# Altium project ICM-42688-P.PrjPcb
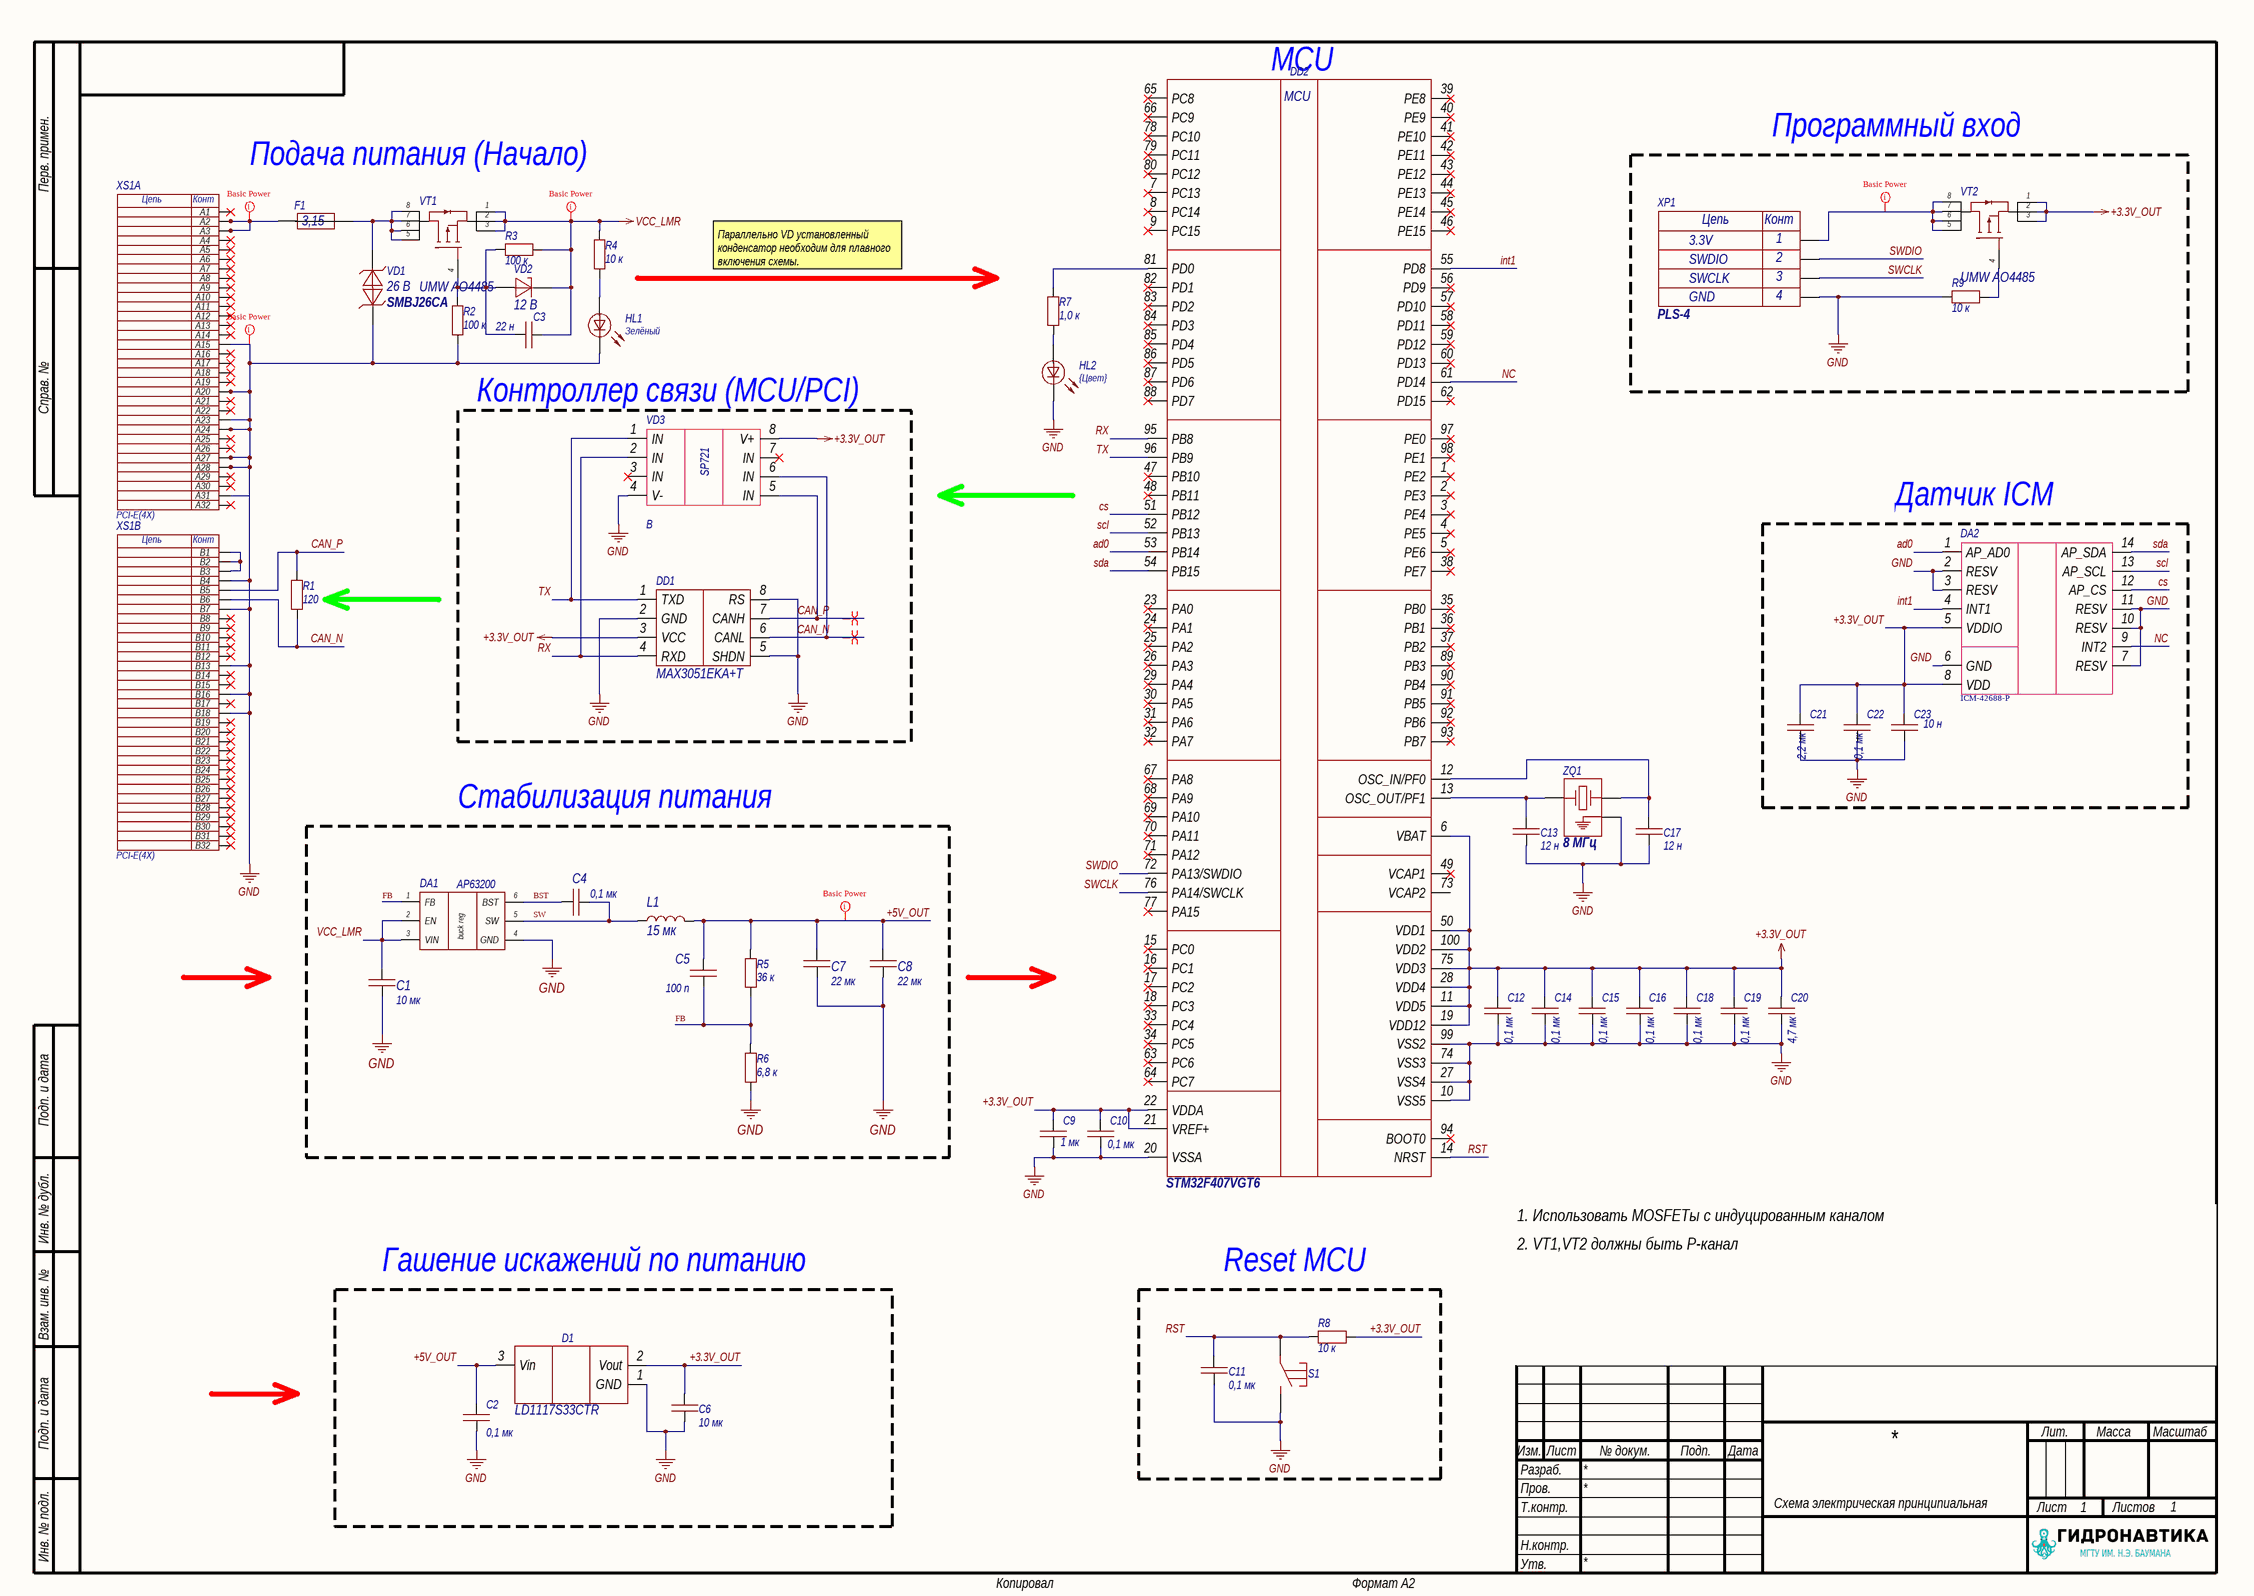
[diagram p0: Sheet1.SchDoc]
1 sheet, 50 parts. Net scope: global (net labels, ports and power ports of the same name join across sheets).
Board file: pci-e.PcbDoc

## Sheet Sheet1.SchDoc
size 594 x 420 mm; SheetNumber: 1; SheetTotal: 1

### Parts
C1  value 10 мк  [1210C]  (hidden comment: Capacitor)
C2  value 0,1 мк  [0603C]  (hidden comment: Capacitor)
C3  value 22 н  [0603C]  (hidden comment: Capacitor)
C4  value 0,1 мк  [0603C]  (hidden comment: Capacitor)
C5  value 100 п  [0603C]  (hidden comment: Capacitor)
C6  value 10 мк  [1210C]  (hidden comment: Capacitor)
C7  value 22 мк  [1210C]  (hidden comment: Capacitor)
C8  value 22 мк  [1210C]  (hidden comment: Capacitor)
C9  value 1 мк  [0603C]  (hidden comment: Capacitor)
C10  value 0,1 мк  [0603C]  (hidden comment: Capacitor)
C11  value 0,1 мк  [0402C]  (hidden comment: Capacitor)
C12  value 0,1 мк  [0603C]  (hidden comment: Capacitor)
C13  value 12 н  [0603C]  (hidden comment: Capacitor)
C14  value 0,1 мк  [0603C]  (hidden comment: Capacitor)
C15  value 0,1 мк  [0603C]  (hidden comment: Capacitor)
C16  value 0,1 мк  [0603C]  (hidden comment: Capacitor)
C17  value 12 н  [0603C]  (hidden comment: Capacitor)
C18  value 0,1 мк  [0603C]  (hidden comment: Capacitor)
C19  value 0,1 мк  [0603C]  (hidden comment: Capacitor)
C20  value 4,7 мк  [1206C]  (hidden comment: Capacitor)
C21  value 2,2 мк  [1206C]  (hidden comment: Capacitor)
C22  value 0,1 мк  [0603C]  (hidden comment: Capacitor)
C23  value 10 н  [0603C]  (hidden comment: Capacitor)
D1  LD1117S33CTR  [SOT223]
DA1  AP63200  [TSOT26]
DA2  ICM-42688-P  [ICM-42688-P]
DD1  MAX3051EKA+T  [SOT23-8]
DD2  STM32F407VGT6  [LQFP100]
F1  value 3,15  [01543.15DR]  (hidden comment: 01543.15DR)
HL1  value Зелёный  [0603D_green]  (hidden comment: LED 0603 GREEN)
HL2  value {Цвет}  [0603D_yellow]  (hidden comment: LED 0603 YELLOW)
L1  value 15 мк  [SP43]  (hidden comment: SP43-150K)
R1  value 120  [0603R]  (hidden comment: Resistor)
R2  value 100 к  [0603R]  (hidden comment: Resistor)
R3  value 100 к  [0603R]  (hidden comment: Resistor)
R4  value 10 к  [0603R]  (hidden comment: Resistor)
R5  value 36 к  [0603R]  (hidden comment: Resistor)
R6  value 6,8 к  [0603R]  (hidden comment: Resistor)
R7  value 1,0 к  [0603R]  (hidden comment: Resistor)
R8  value 10 к  [0603R]  (hidden comment: Resistor)
R9  value 10 к  [0603R]  (hidden comment: Resistor)
S1  TSS-TD-19XA-XTR  [TSS-TD-19XA-XTR]  (value not drawn)
VD1  SMBJ26CA  value 26 В  [SMB]
VD2  value 12 В  [SOD-323]  (hidden comment: BZX384-C12)
VD3  SP721  value В  [SP721]
VT1  UMW AO4485  [SOP8]
VT2  UMW AO4485  [SOP8]
XP1  PLS-4  Value3: SWCLK  Value2: SWDIO  Value4: GND  Value1: 3.3V  [PLS4-90]
XS1  PCI-E(4X)  [PCIexpress_x4_full]  (parts A,B of 2)
ZQ1  value 8 МГц  [QSMD3.2x2.5]  (hidden comment: XTAL_GND)

### Blocks framed on the sheet
Программный вход: R9 VT2 XP1
Контроллер связи (MCU/PCI): DD1 VD3
Датчик ICM: C21-C23 DA2
Стабилизация питания: C1 C4 C5 C7 C8 DA1 L1 R5 R6
Гашение искажений по питанию: C2 C6 D1
Reset MCU: C11 R8 S1

### Nets
+3.3V_OUT: C6.2 C9.2 C10.2 C12.2 C14.2 C15.2 C16.2 C18.2 C19.2 C20.2 C21.2 C22.2 C23.2 D1.2(Vout) DA2.5(VDDIO) DA2.8(VDD) DD1.3(VCC) DD2.6(VBAT) DD2.11(VDD5) DD2.19(VDD12) DD2.21(VREF+) DD2.22(VDDA) DD2.28(VDD4) DD2.50(VDD1) DD2.75(VDD3) DD2.100(VDD2) R8.1 VD3.8(V+) VT2.1 VT2.2 VT2.3
GND: C1.1 C2.1 C6.1 C7.1 C8.1 C9.1 C10.1 C11.1 C12.1 C13.1 C14.1 C15.1 C16.1 C17.1 C18.1 C19.1 C20.1 C21.1 C22.1 C23.1 D1.1(GND) DA1.4(GND) DA2.2(RESV) DA2.3(RESV) DA2.6(GND) DA2.7(RESV) DA2.10(RESV) DA2.11(RESV) DD1.2(GND) DD1.5(SHDN) DD1.8(RS) DD2.10(VSS5) DD2.20(VSSA) DD2.27(VSS4) DD2.74(VSS3) DD2.99(VSS2) HL1.2 HL2.2 R2.1 R6.1 R9.2 S1.2 VD1.1 VD3.4(V-) XP1.4 XS1.A15 XS1.A20 XS1.A23 XS1.A24 XS1.A27 XS1.A28 XS1.A31 XS1.B4 XS1.B7 XS1.B13 XS1.B16 XS1.B18 ZQ1.3
VCC_LMR: C1.2 C3.2 DA1.2(EN) DA1.3(VIN) R3.1 R4.2 VD2.2 VT1.1 VT1.2 VT1.3
+5V_OUT: C2.2 C5.2 C7.2 C8.2 D1.3(Vin) L1.2 R5.2
ad0: DA2.1(AP_AD0) DD2.53(PB14)
BST: C4.1 DA1.6(BST)
CAN_N: DD1.6(CANL) R1.1 VD3.6(IN) XS1.B6
CAN_P: DD1.7(CANH) R1.2 VD3.5(IN) XS1.B5
cs: DA2.12(AP_CS) DD2.51(PB12)
FB: C5.1 DA1.1(FB) R5.1 R6.2
int1: DA2.4(INT1) DD2.55(PD8)
NC: DA2.9(INT2) DD2.61(PD14)
RST: C11.2 DD2.14(NRST) R8.2 S1.1
RX: DD1.4(RXD) DD2.95(PB8) VD3.2(IN)
scl: DA2.13(AP_SCL) DD2.52(PB13)
sda: DA2.14(AP_SDA) DD2.54(PB15)
SW: C4.2 DA1.5(SW) L1.1
SWCLK: DD2.76(PA14/SWCLK) XP1.3
SWDIO: DD2.72(PA13/SWDIO) XP1.2
TX: DD1.1(TXD) DD2.96(PB9) VD3.1(IN)
NetC3_1: C3.1 R2.2 R3.2 VD2.1 VT1.4
NetC13_2: C13.2 DD2.13(OSC_OUT/PF1) ZQ1.1
NetC17_2: C17.2 DD2.12(OSC_IN/PF0) ZQ1.2
NetDD2_81: DD2.81(PD0) R7.2
NetF1_1: F1.1 XS1.A2 XS1.A3
NetF1_2: F1.2 VD1.2 VT1.5 VT1.6 VT1.7 VT1.8
NetHL1_1: HL1.1 R4.1
NetHL2_1: HL2.1 R7.1
NetR9_1: R9.1 VT2.4
NetVT2_5: VT2.5 VT2.6 VT2.7 VT2.8 XP1.1
NetXS1_B1: XS1.B1 XS1.B2 XS1.B3

Not connected (* = marked no-connect by the designer): DD2 1(PE2)* 2(PE3)* 3(PE4)* 4(PE5)* 5(PE6)* 7(PC13)* 8(PC14)* 9(PC15)* 15(PC0)* 16(PC1)* 17(PC2)* 18(PC3)* 23(PA0)* 24(PA1)* 25(PA2)* 26(PA3)* 29(PA4)* 30(PA5)* 31(PA6)* 32(PA7)* 33(PC4)* 34(PC5)* 35(PB0)* 36(PB1)* 37(PB2)* 38(PE7)* 39(PE8)* 40(PE9)* 41(PE10)* 42(PE11)* 43(PE12)* 44(PE13)* 45(PE14)* 46(PE15)* 47(PB10)* 48(PB11)* 49(VCAP1)* 56(PD9)* 57(PD10)* 58(PD11)* 59(PD12)* 60(PD13)* 62(PD15)* 63(PC6)* 64(PC7)* 65(PC8)* 66(PC9)* 67(PA8)* 68(PA9)* 69(PA10)* 70(PA11)* 71(PA12)* 73(VCAP2) 77(PA15)* 78(PC10)* 79(PC11)* 80(PC12)* 82(PD1)* 83(PD2)* 84(PD3)* 85(PD4)* 86(PD5)* 87(PD6)* 88(PD7)* 89(PB3)* 90(PB4)* 91(PB5)* 92(PB6)* 93(PB7)* 94(BOOT0)* 97(PE0)* 98(PE1)*; VD3 3(IN)* 7(IN)*; XS1 A1* A4* A5* A6* A7* A8* A9* A10* A11* A12* A13* A14* A16* A17* A18* A19* A21* A22* A25* A26* A29* A30* A32* B8* B9* B10* B11* B12* B14* B15* B17* B19* B20* B21* B22* B23* B24* B25* B26* B27* B28* B29* B30* B31* B32*

### Layout directives
differential pair: CAN_N, CAN_P
net class Power: +5V_OUT, GND, NetF1_1, NetVT2_5, VCC_LMR

### Notes on the sheet
- (near DD2) MCU
- Подача питания (Начало)
- Параллельно VD установленный конденсатор необходим для плавного включения схемы.
- 1. Использовать MOSFETы с индуцированным каналом
- 2. VT1,VT2 должны быть P-канал
- Перв. примен.
- Справ. №
- Подп. и дата
- Инв. № дубл.
- Взам. инв. №
- Разраб.
- Изм.
- Лист
- № докум.
- Подп.
- Дата
- Лит.
- Масса
- Масштаб
- Пров.
- Т.контр.
- Схема электрическая принципиальная
- Листов
- Инв. № подл.
- Утв.
- Н.контр.
- Копировал
- Формат А2
- (in symbol AP63200) buck reg
- (in symbol PCI-E(4X), part A) Цепь; Конт
- (in symbol PCI-E(4X), part B) Цепь; Конт
- (in symbol PLS4-90) Цепь; Конт
- (in symbol STM32F407VGT6) MCU

### Library data of the parts
C1 = Capacitor_10u_10_35V_X7R_1210C: Конденсатор 1210C ёмкостью 10 мк 10%, 35 В, X7R; Library Path2: Schematic\Capacitor.SchLib; Voltage (V): 35; Capacity (nF): 10000; Part Number: Capacitor_10u_10_35V_X7R_1210C; Tolerance: 10%; Dielectric: X7R
C2 C10 C12 C14-C16 C18 C19 C22 = Capacitor_0,1u_10_50V_X7R_0603C: Конденсатор 0603C ёмкостью 0,1 мк 10%, 50 В, X7R; Voltage (V): 50; Capacity (nF): 100; Part Number: Capacitor_0,1u_10_50V_X7R_0603C; Tolerance: 10%; Dielectric: X7R
C3 = Capacitor_22n_10_50V_X7R_0603C: Конденсатор 0603C ёмкостью 22 н 10%, 50 В, X7R; Voltage (V): 50; Capacity (nF): 22; Part Number: Capacitor_22n_10_50V_X7R_0603C; Tolerance: 10%; Dielectric: X7R
C4 = Capacitor_0,1u_10_50V_X7R_0603C: Конденсатор 0603C ёмкостью 0,1 мк 10%, 50 В, X7R; Library Path2: Schematic\Capacitor.SchLib; Voltage (V): 50; Capacity (nF): 100; Part Number: Capacitor_0,1u_10_50V_X7R_0603C; Tolerance: 10%; Dielectric: X7R
C5 = Capacitor_100p_10_50V_X7R_0603C: Конденсатор 0603C ёмкостью 100 п 10%, 50 В, X7R; Library Path2: Schematic\Capacitor.SchLib; Voltage (V): 50; Capacity (nF): 0,1; Part Number: Capacitor_100p_10_50V_X7R_0603C; Tolerance: 10%; Dielectric: X7R
C6 = Capacitor_10u_10_35V_X7R_1210C: Конденсатор 1210C ёмкостью 10 мк 10%, 35 В, X7R; Voltage (V): 35; Capacity (nF): 10000; Part Number: Capacitor_10u_10_35V_X7R_1210C; Tolerance: 10%; Dielectric: X7R
C7 C8 = Capacitor_22u_10_25V_X7R_1210C: Конденсатор 1210C ёмкостью 22 мк 10%, 25 В, X7R; Library Path2: Schematic\Capacitor.SchLib; Voltage (V): 25; Capacity (nF): 22000; Part Number: Capacitor_22u_10_25V_X7R_1210C; Tolerance: 10%; Dielectric: X7R
C9 = Capacitor_1u_10_25V_X7R_0603C: Конденсатор 0603C ёмкостью 1 мк 10%, 25 В, X7R; Voltage (V): 25; Capacity (nF): 1000; Part Number: Capacitor_1u_10_25V_X7R_0603C; Tolerance: 10%; Dielectric: X7R
C11 = Capacitor_0,1u_10_16V_X7R_0603C: Конденсатор 0402C ёмкостью 0,1 мк 10%, 16 В, X7R; Voltage (V): 16; Capacity (nF): 100; Автор: rreali; Part Number: Capacitor_0,1u_10_16V_X7R_0603C; Tolerance: 10%; Dielectric: X7R
C13 C17 = Capacitor_12n_10_50V_X7R_0603C: Конденсатор 0603C ёмкостью 12 н 10%, 50 В, X7R; Voltage (V): 50; Capacity (nF): 12; Part Number: Capacitor_12n_10_50V_X7R_0603C; Tolerance: 10%; Dielectric: X7R
C20 = Capacitor_4,7u_10_50V_X7R_1206C: Конденсатор 1206C ёмкостью 4,7 мк 10%, 50 В, X7R; Voltage (V): 50; Capacity (nF): 4700; Part Number: Capacitor_4,7u_10_50V_X7R_1206C; Tolerance: 10%; Dielectric: X7R
C21 = Capacitor_2,2u_10_50V_X7R_1206C: Конденсатор 1206C ёмкостью 2,2 мк 10%, 50 В, X7R; Voltage (V): 50; Capacity (nF): 2200; Part Number: Capacitor_2,2u_10_50V_X7R_1206C; Tolerance: 10%; Dielectric: X7R
C23 = Capacitor_10n_10_50V_X7R_0603C: Конденсатор 0603C ёмкостью 10 н 10%, 50 В, X7R; Voltage (V): 50; Capacity (nF): 10; Part Number: Capacitor_10n_10_50V_X7R_0603C; Tolerance: 10%; Dielectric: X7R
D1 = LD1117S33CTR: Линейный стабилизатор напряжения; Part Number: LD1117S33CTR
DA1 = AP63200: DC-DC понижающий преобразователь, Vin: 3.8 - 40 В, adj, 2 А; Part Number: AP63200
DA2 = ICM-42688-P: Датчик положения ICM-42688-P; Part Number: ICM-42688-P
DD1 = MAX3051EKA+T: CAN трансивер 1Mbps +3.3В; Автор: glebmih; Part Number: MAX3051EKA+T; Datasheet: https://static.chipdip.ru/lib/876/DOC015876362.pdf
DD2 = STM32F407VGT6: Микроконтроллер; Part Number: STM32F407VGT6
F1 = 01543.15DR: 01543.15DR, SMD Предохранитель + Держатель Очень быстродействующий 3,15А (8051399152); Автор: FedorPOU; Part Number: 01543.15DR; Datasheet: https://static.chipdip.ru/lib/754/DOC031754012.pdf
HL1 = LED 0603 GREEN: Светодиод 0603 Зелёный; Part Number: LED 0603 GREEN
HL2 = LED 0603 YELLOW: Светодиод 0603 Жёлтый; Part Number: LED 0603 YELLOW
L1 = SP43-150K: Индуктивность на 15 мкГн, номинальный ток 1,3 А; Inductance (μH): 15; Current (A): 1,3; Part Number: SP43-150K
R1 = RC0603FR-07120RL: Резистор номиналом 120 Ом 1% 0603; Power: *; Part Number: RC0603FR-07120RL; Tolerance: 1%
R2 R3 = RC0603FR-07100KL: Резистор номиналом 100 к Ом 1% 0603; Power: *; Part Number: RC0603FR-07100KL; Tolerance: 1%
R4 R8 R9 = RC0603FR-0710KL: Резистор номиналом 10 к Ом 1% 0603; Power: *; Part Number: RC0603FR-0710KL; Tolerance: 1%
R5 = RC0603FR-0736KL: Резистор номиналом 36 к Ом 1% 0603; Power: *; Part Number: RC0603FR-0736KL; Tolerance: 1%
R6 = RC0603FR-076K8L: Резистор номиналом 6,8 к Ом 1% 0603; Power: *; Part Number: RC0603FR-076K8L; Tolerance: 1%
R7 = RC0603FR-071KL: Резистор номиналом 1,0 к Ом 1% 0603; Power: *; Part Number: RC0603FR-071KL; Tolerance: 1%
S1 = TSS-TD-19XA-XTR: Тактовая кнопка; Part Number: TSS-TD-19XA-XTR
VD1 = SMBJ26CA: Двунаправленный защитный диод на 26 В, рассеиваемая мощность 600 Вт; Voltage (V): 26; Power (W): 600; Автор: FedorPOU; Part Number: SMBJ26CA
VD2 = BZX384-C12: Стабилитрон на 12 В, рассеиваемая мощность 0.3 Вт; Voltage (V): 12; Current: 5 мА; Power (W): 0.3; Accuracy: 0,05; Part Number: BZX384-C12
VD3 = SP721: SP721ABG, ESD Protection Diodes / TVS Diodes 6 CH DIODE ARRAY, SP721ABG, 8004597169; Автор: FedorPOU; Part Number: SP721
VT1 VT2 = UMW AO4485: P-канальный MOSFET; Автор: FedorPOU; Part Number: UMW AO4485
XP1 = PLS4-90: Гребенка 4 пина; System: Connector; Автор: FedorPOU; Part Number: PLS4-90
ZQ1 = XTAL_GND: Кварцевый резонатор с входом земли; Part Number: XTAL_GND
XS1 = PCI-E(4X): Part Number: PCI-E(4X)